# EasyEDA Pro project ProProject_25电赛备赛_2025-07-07.epro, board PCB3
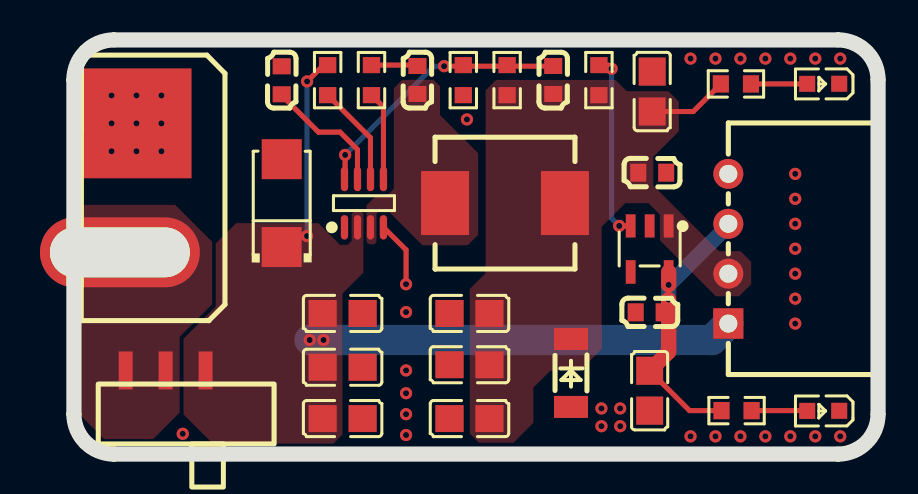
[diagram p2: board, top side]
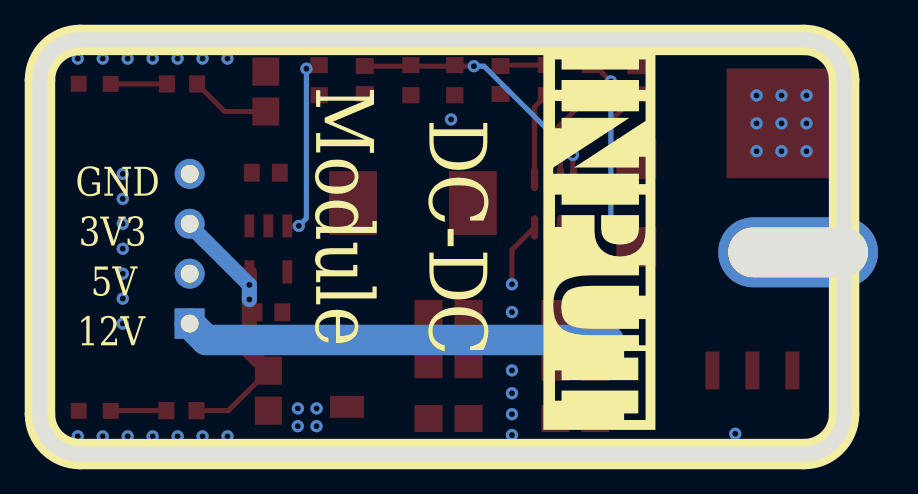
[diagram p3: board, bottom side, seen from below]

Outline 40.24 x 20.75 mm; copper layers: Top Layer, Bottom Layer. Coordinates in mm from the lower left corner of the outline.
Outline path: 0,18.75 0,2 arc(0.59,0.59) 2,0 38.24,0 arc(39.66,0.59) 40.24,2 40.24,18.75 arc(39.66,20.16) 38.24,20.75 2,20.75 arc(0.59,20.16) 0,18.75
Stack: Top Layer 0.035mm / Dielectric1 1.51mm FR4 er 4.5 / Bottom Layer 0.035mm

## Design rules (mm)
template: 自定义配置
spacing copperThickness1oz (default): track to track 0.102, other pairs 0.152 to 0.3
spacing copperThickness2oz: track to track 0.203, other pairs 0.152 to 0.3
track width copperThickness1oz (default): min 0.127, default 0.254, max 2.54
track width copperThickness2oz: min 0.203, default 0.254, max 2.54
differential pair differentialPair (default): width min 0.127, default 0.254, max 2.54; gap min 0.152, default 0.152
via viaSize (default): diameter min 0.5, default 0.61, max 10; hole min 0.3, default 0.305, max 6.3

## Placement (name value [footprint] x y rotation side)
C12  100nF  [C0805]  13.45 1.78 180 top
C13  22uF  [C0805]  13.45 7.05 180 top
C14  22uF  [C0805]  13.45 4.35 180 top
C15  22uF  [C0805]  19.8 7.05 0 top
C16  22uF  [C0805]  19.8 4.48 0 top
C17  22uF  [C0805]  19.8 1.78 0 top
C24  22uF  [C0805]  28.94 18.16 90 top
C25  100nF  [C0603]  28.94 14.1 0 top
C26  100nF  [C0603]  28.82 7.1 180 top
C27  22uF  [C0805]  28.82 3.17 270 top
CN3  ZX-XH2.54-4PWZ  [CONN-TH_4P-P2.50_ZX-XH2.54-4PWZ]  32.75 10.29 90 top
D3  SMAJ12A  [SMA_L4.3-W2.6-LS5.2-RD]  10.4 12.57 90 top
D4  ZMM5V1  [LL-34_L3.5-W1.5-RD]  24.88 4.06 270 top
L2  3.3uH  [IND-SMD_L7.0-W6.6]  21.58 12.57 0 top
LED1  -  [LED_0603]  37.45 18.54 180 top
LED2  -  [LED_0603]  37.45 2.16 180 top
R8  10kΩ  [R0603]  12.7 18.73 270 top
R9  10Ω  [R0603]  14.89 18.73 90 top
R10  100KΩ  [R0603]  21.68 18.73 270 top
R11  13.7kΩ  [R0603]  19.49 18.73 90 top
R12  10K  [R0603]  26.27 18.73 270 top
R13  10K  [R0603]  33.13 18.54 0 top
R14  10K  [R0603]  33.16 2.18 0 top
U3  RT9013-33GB  [SOT-23-5_L3.0-W1.7-P0.95-LS2.8-BL]  28.82 10.28 180 top
U8  MP2236  [TSOT23-8]  14.46 12.45 0 top
U9  100nF  [C0603]  10.4 18.72 270 top
U10  100nF  [C0603]  17.19 18.74 90 top
U11  220pF  [C0603]  23.99 18.74 90 top
U12  -  [T插-卧]  2.91 13.33 90 top
U35  -  [12d18a]  5.57 1.91 180 top

## Footprints (pads in the part's own frame, mm; a bottom-side part is the same pattern mirrored in y, then rotated)
12d18a
  rect 0.7x1.9 smd: 1(-1.016,-2.286) 2(0.984,-2.286) 3(2.984,-2.286)
C0603
  rect 0.8x0.9 smd: 1(-0.7,0) 2(0.7,0)
C0805
  rect 1.41x1.35 smd: 1(-1,0) 2(1,0)
CONN-TH_4P-P2.50_ZX-XH2.54-4PWZ
  rect 1.524x1.5 hole 0.9: 1(-3.75,0)
  round 1.5 hole 0.9: 2(-1.25,0) 3(1.25,0) 4(3.75,0)
IND-SMD_L7.0-W6.6
  rect 2.4x3.2 smd: 1(-3,0) 2(3,0)
LED_0603
  rect 0.8x0.8 smd: 1(-0.851,-0.01) 2(0.75,-0.005)
LL-34_L3.5-W1.5-RD
  rect 1.1x1.7 smd: 1(-1.7,0) 2(1.7,0)
R0603
  rect 0.806x0.864 smd: 1(-0.753,0) 2(0.753,0)
SMA_L4.3-W2.6-LS5.2-RD
  rect 2x2 smd: 1(-2.2,0) 2(2.2,0)
SOT-23-5_L3.0-W1.7-P0.95-LS2.8-BL
  rect 0.49x1.157 smd: 1(-0.95,-1.153) 2(0,-1.153) 3(0.95,-1.153)
  rect 0.49x1.175 smd: 4(0.95,1.153) 5(-0.95,1.153)
TSOT23-8
  oval 0.364x1.222 smd: 1(-0.922,-1.087) 2(-0.272,-1.087) 3(0.378,-1.087) 4(1.028,-1.087) 5(1.028,1.335) 6(0.378,1.335) 7(-0.272,1.335) 8(-0.922,1.335)
T插-卧
  oval 3.5x8 hole 2.5x7: 1(-3.23,0.606)
  rect 5.5x5.5 smd: 2(3.232,-0.225)

## Nets
3V3: C26.1 C27.1 CN3.3 R14.1 U3.5
5V: C15.2 C16.2 C17.2 C24.1 C25.1 CN3.2 D4.1 L2.2 R10.2 R12.2 R13.1 U3.1 U11.1
GND: C12.1 C13.1 C14.1 C15.1 C16.1 C17.1 C24.2 C25.2 C26.2 C27.2 CN3.4 D3.2 D4.2 LED1.1 LED2.1 R11.1 U3.2 U8.1 U8.4 U9.1 U12.2
VCC: U12.1 U35.2 U35.3
VIN: C12.2 C13.2 C14.2 CN3.1 D3.1 R8.1 U8.2 U35.1
$1N1905: R8.2 U8.6
$1N1907: U8.7 U9.2
$1N1913: R9.1 U8.5
$1N1914: R9.2 U10.2
$1N1915: L2.1 U8.3 U10.1
$1N1916: R10.1 R11.2 U8.8 U11.2
$1N6612: R12.1 U3.3
$1N6905: LED1.2 R13.2
$1N7345: LED2.2 R14.2

Pads without a net: U3 4

## Via types
v1: diameter 0.61, hole 0.305, Top Layer to Bottom Layer, 52 vias

## Routing (per net, layer and track width the routed paths; a pad name or vN(x,y) marks a point on that pad's centre or on a via; arc(x,y) is an arc through that point)
3V3: length 14.1
  Top Layer w0.254: C27.1 30.81,2.18 R14.1
  Top Layer w0.762: v1(29.77,7.74) 29.77,5.12 C27.1 ; v1(29.77,8.48) U3.5
  Bottom Layer w0.762: v1(29.77,7.74) v1(29.77,8.48) 32.75,11.46 CN3.3
5V: length 4
  Top Layer w0.254: C24.1 31,17.16 R13.1
GND: length 3.3
  Top Layer w0.254: v1(16.62,8.51) 16.62,10.23 U8.4
  vias: v1(1.88,17.96) v1(1.88,16.57) v1(1.88,15.17) v1(3.13,17.96) v1(3.13,16.57) v1(3.13,15.17) v1(4.38,17.96) v1(4.38,16.57) v1(4.38,15.17) v1(5.45,1.02) v1(16.62,7.11) v1(16.62,4.19) v1(16.62,3.05) v1(16.62,2) v1(16.62,0.95) v1(19.67,16.76) v1(26.4,2.29) v1(26.4,1.4) v1(27.34,2.29) v1(27.34,1.4) v1(30.86,19.81) v1(30.86,0.89) v1(32.11,19.81) v1(32.11,0.89) v1(33.36,19.81) v1(33.36,0.89) v1(34.61,19.81) v1(34.61,0.89) v1(35.86,19.81) v1(35.86,0.89) v1(36.1,14.04) v1(36.1,12.79) v1(36.1,11.54) v1(36.1,10.29) v1(36.1,9.04) v1(36.1,7.79) v1(36.1,6.54) v1(37.1,19.81) v1(37.1,0.89) v1(38.35,19.81) v1(38.35,0.89)
VIN: length 30.4
  Top Layer w0.254: v1(11.67,18.67) 12.49,19.49 12.7,19.49
  Bottom Layer w0.254: v1(11.67,18.67) v1(11.67,10.92)
  Bottom Layer w1.524: CN3.1 31.93,5.71 v1(12.49,5.71) v1(11.8,5.71)
$1N1905: length 5.1
  Top Layer w0.254: U8.6 14.84,15.84 12.7,17.99
$1N1907: length 6.4
  Top Layer w0.254: U8.7 14.19,15.26 13.32,16.13 12.24,16.13 10.4,17.97
$1N1913: length 4.5
  Top Layer w0.254: U8.5 15.49,17.39 14.89,17.99
$1N1914: length 2.3
  Top Layer w0.254: U10.2 17.15,19.49 14.89,19.49
$1N1916: length 13.5
  Top Layer w0.254: 23.99,19.5 23.92,19.43 v1(18.53,19.43) ; v1(13.58,14.99) 13.58,13.81 13.54,13.78
  Bottom Layer w0.254: v1(18.53,19.43) 18.02,19.43 v1(13.58,14.99)
$1N6612: length 9.3
  Top Layer w0.254: v1(27.29,11.43) U3.3 ; 26.27,19.49 26.73,19.49 v1(26.91,19.3)
  Bottom Layer w0.254: v1(27.29,11.43) 26.91,11.81 v1(26.91,19.3)
$1N6905: length 2.8
  Top Layer w0.254: LED1.2 36.7,18.54 R13.2
$1N7345: length 2.8
  Top Layer w0.254: 36.7,2.16 36.69,2.18 R14.2

## Copper pours and planes (outline as drawn; the poured copper is in the pictures)
5V on Top Layer: 19.81,18.74 33.89,18.74 33.89,0.57 19.81,0.57
GND on Top Layer: -3.82,25.27 44.18,25.27 44.18,-2.79 -3.82,-2.79
GND on Bottom Layer: -1.28,22.35 41.52,22.35 41.52,-5.59 -1.28,-5.59
VCC on Top Layer: 0.34,12.49 6.92,12.49 6.92,0.75 0.34,0.75
VIN on Top Layer: 5.49,12.17 14.49,12.17 14.49,0.52 5.49,0.52
$1N1915 on Top Layer: 14.65,18.75 20.23,18.75 20.23,10.46 14.65,10.46

## Text on the board
Bottom Silkscreen Layer: 5V | 3V3 | 12V | GND | DC-DC | Module | INPUT
